# Altium schematic sheet Servo1.SchDoc
size 420 x 297 mm; SheetNumber: 7; SheetTotal: 26
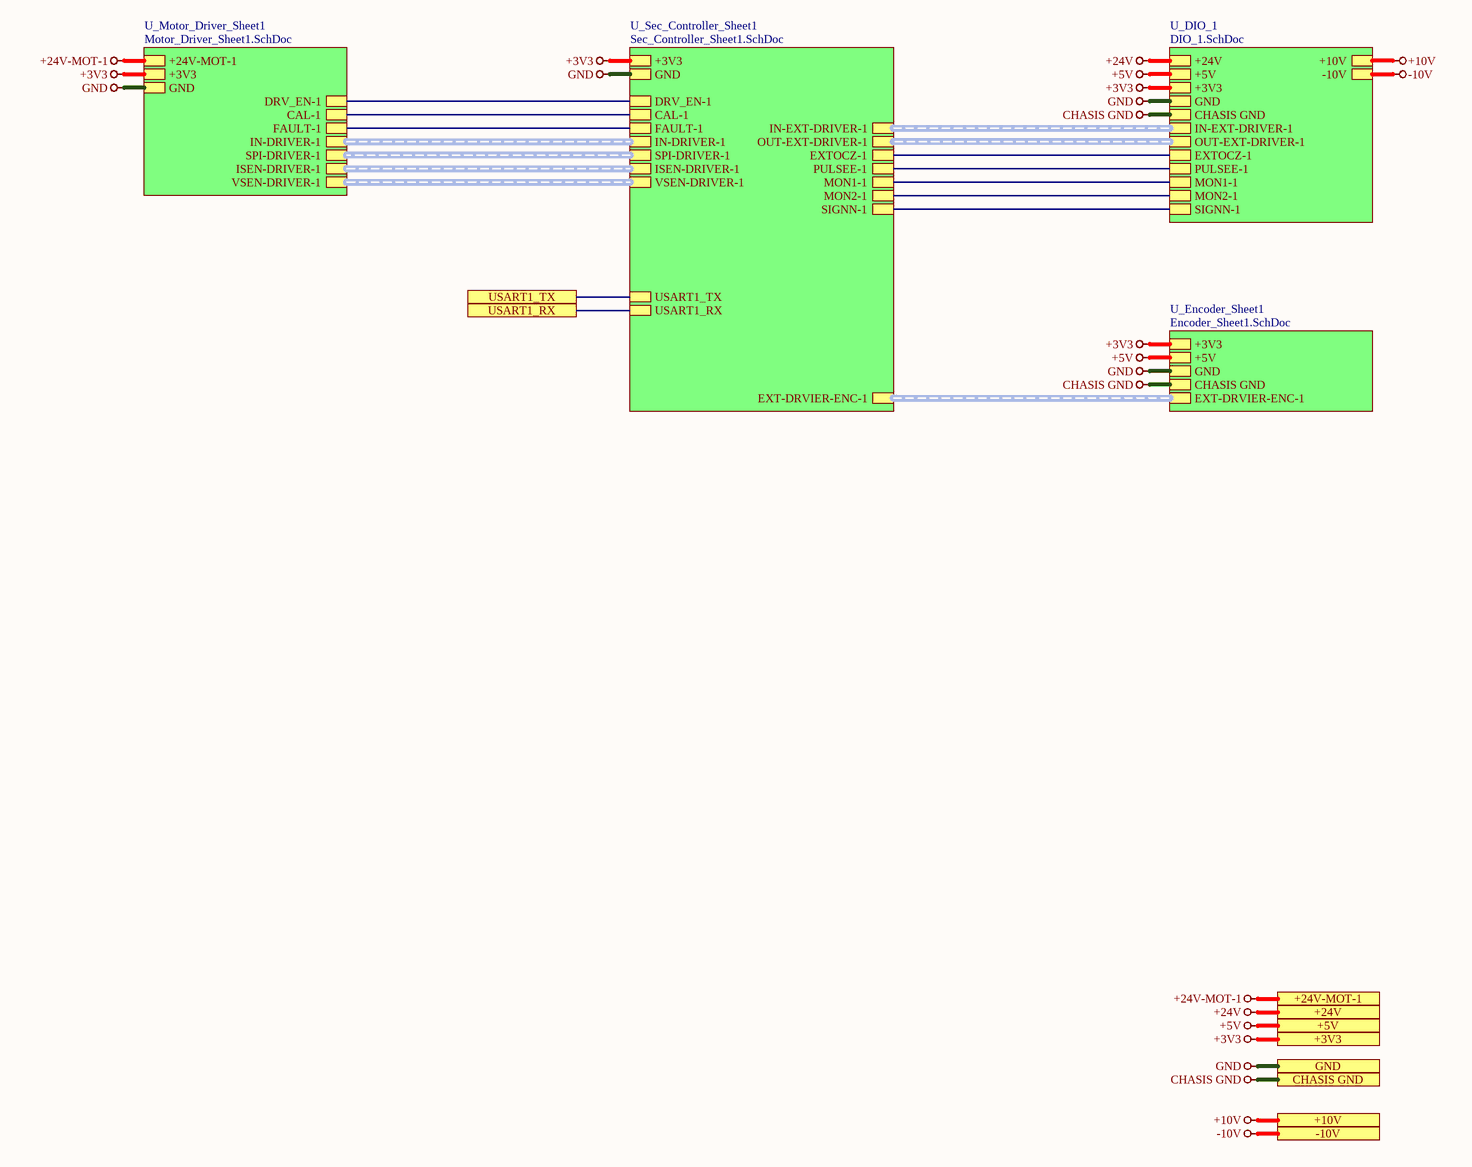
[diagram p0: Servo1.SchDoc]

## Sub-sheets
U_DIO_1 = DIO_1.SchDoc: +24V, +5V, GND, +3V3, CHASIS GND, IN-EXT-DRIVER-1 (harness IN-EXT-DRIVER-1), OUT-EXT-DRIVER-1 (harness OUT-EXT-DRIVER-1), EXTOCZ-1, PULSEE-1, MON1-1, MON2-1, SIGNN-1, +10V, -10V
U_Encoder_Sheet1 = Encoder_Sheet1.SchDoc: +3V3, +5V, GND, CHASIS GND, EXT-DRVIER-ENC-1 (harness EXT-DRVIER-ENC-1)
U_Motor_Driver_Sheet1 = Motor_Driver_Sheet1.SchDoc: +24V-MOT-1, +3V3, GND, IN-DRIVER-1 (harness IN-DRIVER-1), DRV_EN-1, CAL-1, FAULT-1, SPI-DRIVER-1 (harness SPI-DRIVER-1), ISEN-DRIVER-1 (harness ISEN-DRIVER-1), VSEN-DRIVER-1 (harness VSEN-DRIVER-1)
U_Sec_Controller_Sheet1 = Sec_Controller_Sheet1.SchDoc: +3V3, GND, IN-DRIVER-1 (harness IN-DRIVER-1), DRV_EN-1, CAL-1, FAULT-1, SPI-DRIVER-1 (harness SPI-DRIVER-1), ISEN-DRIVER-1 (harness ISEN-DRIVER-1), EXT-DRVIER-ENC-1 (harness EXT-DRVIER-ENC-1), IN-EXT-DRIVER-1 (harness IN-EXT-DRIVER-1), OUT-EXT-DRIVER-1 (harness OUT-EXT-DRIVER-1), EXTOCZ-1, PULSEE-1, MON1-1, MON2-1, SIGNN-1, USART1_TX, USART1_RX, VSEN-DRIVER-1 (harness VSEN-DRIVER-1)

## Ports
+3V3 (see Top_Sheet[5A], CAN_Sheet[4D], Controller_Sheet[5D], DIO_1[5D], DIO_2[5D], DIO_3[5D], DIO_4[5D], Encoder_Sheet1[5D], Encoder_Sheet2[4D], Encoder_Sheet3[4D], Encoder_Sheet4[5D], EtherCAT_Sheet[5D], Motor_Driver_Sheet1[5D], Motor_Driver_Sheet2[5D], Motor_Driver_Sheet3[5D], Motor_Driver_Sheet4[5D], Power_Sheet[5D], RS485_RS232_Sheet[5D], Sec_Controller_Sheet1[5D], Sec_Controller_Sheet2[5D], Sec_Controller_Sheet3[5D], Sec_Controller_Sheet4[5D], Servo2[5D], Servo3[5D], Servo4[5D]), +5V (see Top_Sheet[5A], CAN_Sheet[4D], Controller_Sheet[5D], DIO_1[5D], DIO_2[5D], DIO_3[5D], DIO_4[5D], Encoder_Sheet1[5D], Encoder_Sheet2[4D], Encoder_Sheet3[4D], Encoder_Sheet4[5D], Power_Sheet[5D], Servo2[5D], Servo3[5D], Servo4[5D]), +10V (see Top_Sheet[5A], DIO_1[5D], DIO_2[5D], DIO_3[5D], DIO_4[5D], Power_Sheet[5D], Servo2[5D], Servo3[5D], Servo4[5D]), +24V (see Top_Sheet[5A], DIO_1[5D], DIO_2[5D], DIO_3[5D], DIO_4[5D], Power_Sheet[5D], Servo2[5D], Servo3[5D], Servo4[5D]), +24V-MOT-1 (see Top_Sheet[5A], Motor_Driver_Sheet1[5D], Power_Sheet[5D]), -10V (see Top_Sheet[5A], DIO_1[5D], DIO_2[5D], DIO_3[5D], DIO_4[5D], Power_Sheet[5D], Servo2[5D], Servo3[5D], Servo4[5D]), CHASIS GND (see Top_Sheet[5A], DIO_1[5D], DIO_2[5D], DIO_3[5D], DIO_4[5D], Encoder_Sheet1[5D], Encoder_Sheet2[4D], Encoder_Sheet3[4D], Encoder_Sheet4[5D], EtherCAT_Sheet[5D], Power_Sheet[5D], Servo2[5D], Servo3[5D], Servo4[5D]), GND (see Top_Sheet[5A], CAN_Sheet[4D], Controller_Sheet[5D], DIO_1[5D], DIO_2[5D], DIO_3[5D], DIO_4[5D], Encoder_Sheet1[5D], Encoder_Sheet2[4D], Encoder_Sheet3[4D], Encoder_Sheet4[5D], EtherCAT_Sheet[5D], Motor_Driver_Sheet1[5D], Motor_Driver_Sheet2[5D], Motor_Driver_Sheet3[5D], Motor_Driver_Sheet4[5D], Power_Sheet[5D], RS485_RS232_Sheet[5D], Sec_Controller_Sheet1[5D], Sec_Controller_Sheet2[5D], Sec_Controller_Sheet3[5D], Sec_Controller_Sheet4[5D], Servo2[5D], Servo3[5D], Servo4[5D]), USART1_RX (see Top_Sheet[5A], Controller_Sheet[4D], Sec_Controller_Sheet1[5D]), USART1_TX (see Top_Sheet[5A], Controller_Sheet[4D], Sec_Controller_Sheet1[5D])

## Nets
+3V3: port +3V3, sheet U_Sec_Controller_Sheet1/+3V3, sheet U_Motor_Driver_Sheet1/+3V3, sheet U_Encoder_Sheet1/+3V3, sheet U_DIO_1/+3V3
+5V: port +5V, sheet U_Encoder_Sheet1/+5V, sheet U_DIO_1/+5V
+10V: port +10V, sheet U_DIO_1/+10V
+24V: port +24V, sheet U_DIO_1/+24V
+24V-MOT-1: port +24V-MOT-1, sheet U_Motor_Driver_Sheet1/+24V-MOT-1
-10V: port -10V, sheet U_DIO_1/-10V
CHASIS GND: port CHASIS GND, sheet U_Encoder_Sheet1/CHASIS GND, sheet U_DIO_1/CHASIS GND
GND: port GND, sheet U_Sec_Controller_Sheet1/GND, sheet U_Motor_Driver_Sheet1/GND, sheet U_Encoder_Sheet1/GND, sheet U_DIO_1/GND
USART1_RX: port USART1_RX, sheet U_Sec_Controller_Sheet1/USART1_RX
USART1_TX: port USART1_TX, sheet U_Sec_Controller_Sheet1/USART1_TX
(unnamed): sheet U_Sec_Controller_Sheet1/DRV_EN-1, sheet U_Motor_Driver_Sheet1/DRV_EN-1
(unnamed): sheet U_Sec_Controller_Sheet1/CAL-1, sheet U_Motor_Driver_Sheet1/CAL-1
(unnamed): sheet U_Sec_Controller_Sheet1/FAULT-1, sheet U_Motor_Driver_Sheet1/FAULT-1
(unnamed): sheet U_Sec_Controller_Sheet1/EXTOCZ-1, sheet U_DIO_1/EXTOCZ-1
(unnamed): sheet U_Sec_Controller_Sheet1/PULSEE-1, sheet U_DIO_1/PULSEE-1
(unnamed): sheet U_Sec_Controller_Sheet1/MON1-1, sheet U_DIO_1/MON1-1
(unnamed): sheet U_Sec_Controller_Sheet1/MON2-1, sheet U_DIO_1/MON2-1
(unnamed): sheet U_Sec_Controller_Sheet1/SIGNN-1, sheet U_DIO_1/SIGNN-1

## Buses and harness runs
harness sheet U_DIO_1/IN-EXT-DRIVER-1 = sheet U_Sec_Controller_Sheet1/IN-EXT-DRIVER-1
harness sheet U_DIO_1/OUT-EXT-DRIVER-1 = sheet U_Sec_Controller_Sheet1/OUT-EXT-DRIVER-1
harness sheet U_Encoder_Sheet1/EXT-DRVIER-ENC-1 = sheet U_Sec_Controller_Sheet1/EXT-DRVIER-ENC-1
harness sheet U_Motor_Driver_Sheet1/IN-DRIVER-1 = sheet U_Sec_Controller_Sheet1/IN-DRIVER-1
harness sheet U_Motor_Driver_Sheet1/ISEN-DRIVER-1 = sheet U_Sec_Controller_Sheet1/ISEN-DRIVER-1
harness sheet U_Motor_Driver_Sheet1/SPI-DRIVER-1 = sheet U_Sec_Controller_Sheet1/SPI-DRIVER-1
harness sheet U_Motor_Driver_Sheet1/VSEN-DRIVER-1 = sheet U_Sec_Controller_Sheet1/VSEN-DRIVER-1

## Notes on the sheet
- File:
- Title:
- Date:
- Page
- Num:
- Total:
- Drawn By: Huzaifa Ali